# EAGLE design schemat (EAGLE 7.6.0)
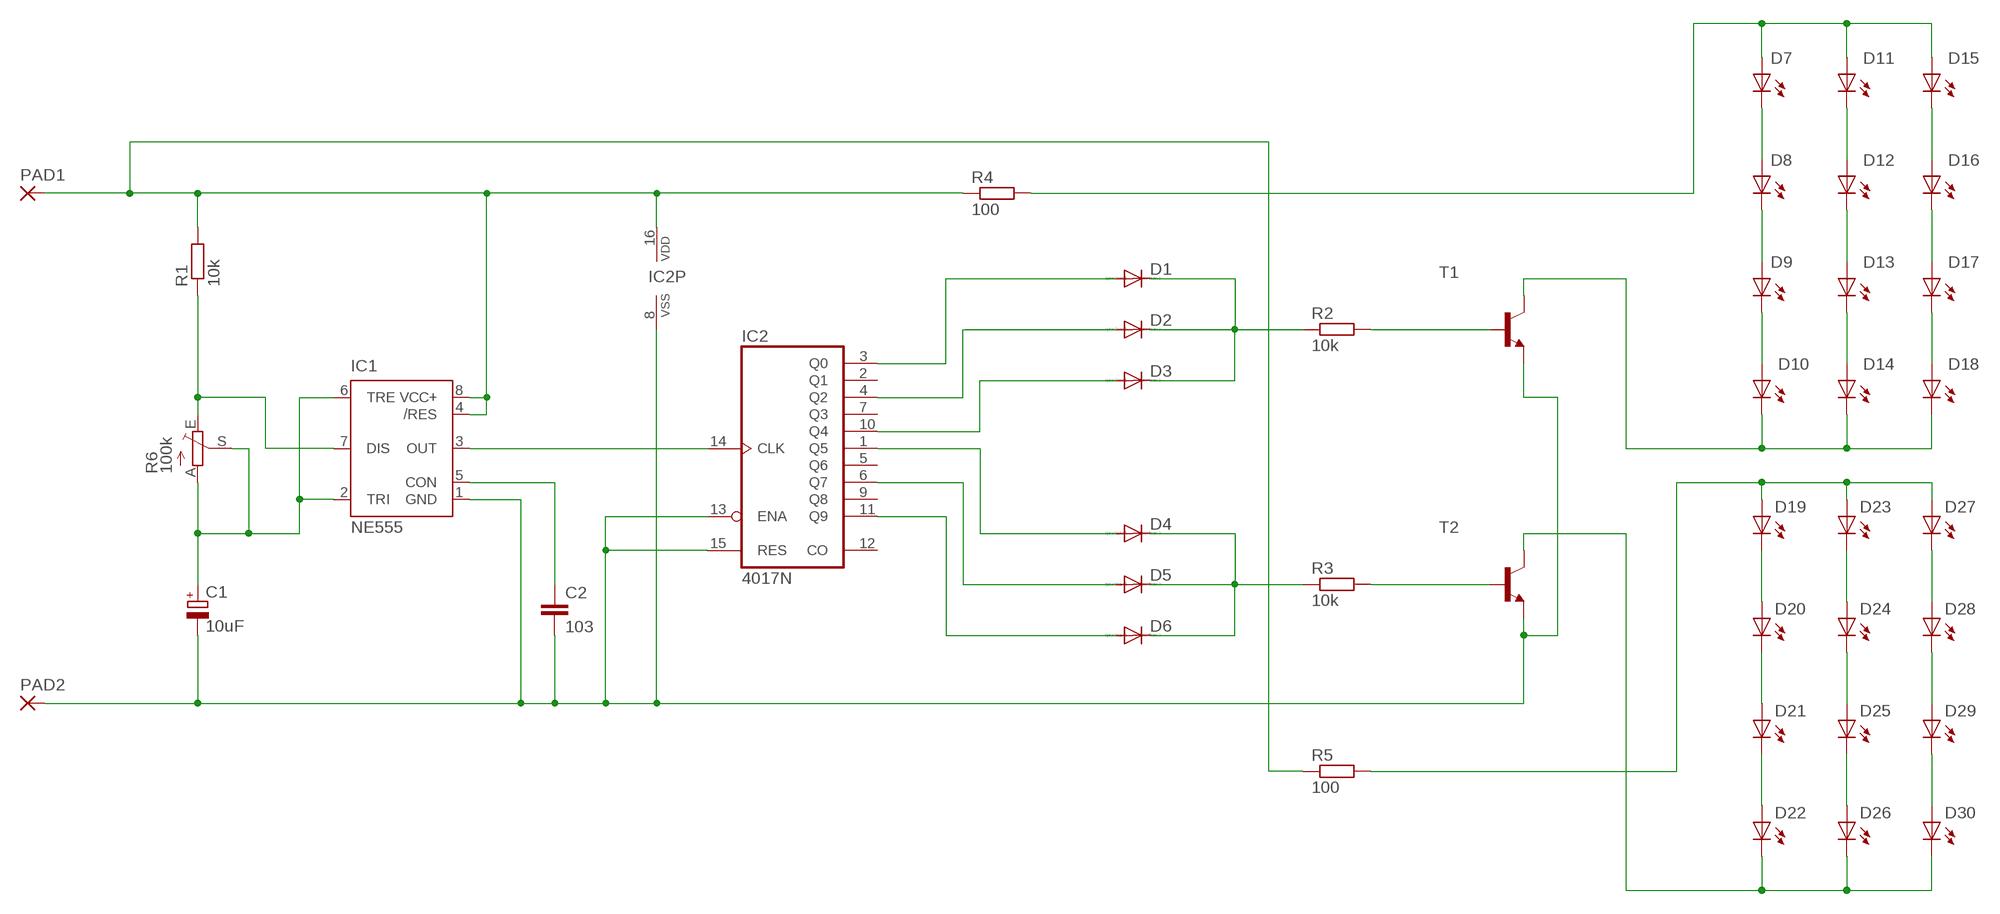
[diagram p0: schematic, sheet 1]

## Parts
C1  10uF  CPOL-EUE2-4  [E2-4]
C2  103  C-EU025-024X044  [C025-024X044]
D1  1N4148DO35-7  [DO35-7]
D2  1N4148DO35-7  [DO35-7]
D3  1N4148DO35-7  [DO35-7]
D4  1N4148DO35-7  [DO35-7]
D5  1N4148DO35-7  [DO35-7]
D6  1N4148DO35-7  [DO35-7]
D7  LED5MM  [LED5MM]
D8  LED5MM  [LED5MM]
D9  LED5MM  [LED5MM]
D10  LED5MM  [LED5MM]
D11  LED5MM  [LED5MM]
D12  LED5MM  [LED5MM]
D13  LED5MM  [LED5MM]
D14  LED5MM  [LED5MM]
D15  LED5MM  [LED5MM]
D16  LED5MM  [LED5MM]
D17  LED5MM  [LED5MM]
D18  LED5MM  [LED5MM]
D19  LED5MM  [LED5MM]
D20  LED5MM  [LED5MM]
D21  LED5MM  [LED5MM]
D22  LED5MM  [LED5MM]
D23  LED5MM  [LED5MM]
D24  LED5MM  [LED5MM]
D25  LED5MM  [LED5MM]
D26  LED5MM  [LED5MM]
D27  LED5MM  [LED5MM]
D28  LED5MM  [LED5MM]
D29  LED5MM  [LED5MM]
D30  LED5MM  [LED5MM]
IC1  NE555  [DIL-08]
IC2  4017N  [DIL16]
PAD1  WIREPAD3,17/1,3  [3,17/1,3]
PAD2  WIREPAD3,17/1,3  [3,17/1,3]
R1  10k  R-EU_0207/7  [0207/7]
R2  10k  R-EU_0207/7  [0207/7]
R3  10k  R-EU_0207/7  [0207/7]
R4  100  R-EU_0207/7  [0207/7]
R5  100  R-EU_0207/7  [0207/7]
R6  100k  TRIM_EU-CA6V  [CA6V]
T1  -NPN-TO92  [TO92]
T2  -NPN-TO92  [TO92]

## Nets
N$1: D4.C D5.C D6.C R3.1
N$2: D6.A IC2.11(Q9)
N$3: D5.A IC2.6(Q7)
N$4: D4.A IC2.1(Q5)
N$5: D3.A IC2.10(Q4)
N$6: D2.A IC2.4(Q2)
N$7: D1.A IC2.3(Q0)
N$8: D1.C D2.C D3.C R2.1
N$9: R2.2 T1.2(B)
N$10: R3.2 T2.2(B)
N$11: D10.K(C) D14.K(C) D18.K(C) T1.3(C)
N$12: D22.K(C) D26.K(C) D30.K(C) T2.3(C)
N$13: IC1.4(/RES) IC1.8(VCC+) IC2.16(VDD) PAD1.1(P) R1.2 R4.1 R5.1
N$14: D19.A D23.A D27.A R5.2
N$15: D27.K(C) D28.A
N$16: D28.K(C) D29.A
N$17: D29.K(C) D30.A
N$18: D21.K(C) D22.A
N$19: D20.K(C) D21.A
N$20: D19.K(C) D20.A
N$21: D23.K(C) D24.A
N$22: D24.K(C) D25.A
N$23: D25.K(C) D26.A
N$24: D17.K(C) D18.A
N$25: D13.K(C) D14.A
N$26: D9.K(C) D10.A
N$27: D7.K(C) D8.A
N$28: D11.K(C) D12.A
N$29: D15.K(C) D16.A
N$30: D16.K(C) D17.A
N$31: D12.K(C) D13.A
N$32: D8.K(C) D9.A
N$33: D7.A D11.A D15.A R4.2
N$35: IC1.7(DIS) R1.1 R6.E
N$36: C1.+ IC1.2(TRI) IC1.6(TRE) R6.A R6.S
N$38: C2.1 IC1.5(CON)
N$39: C1.- C2.2 IC1.1(GND) IC2.8(VSS) IC2.13(ENA) IC2.15(RES) PAD2.1(P) T1.1(E) T2.1(E)
N$40: IC1.3(OUT) IC2.14(CLK)
Unconnected: IC2.2(Q1) IC2.5(Q6) IC2.7(Q3) IC2.9(Q8) IC2.12(CO)

## Library data of the parts
C1 = resistor:CPOL-EU: POLARIZED CAPACITOR, European symbol
C2 = rcl:C-EU: CAPACITOR, European symbol
D1-D6 = diode:1N4148: DIODE high speed (Philips)
D7-D30 = led:LED: LED OSRAM: - CHIPLED LG R971, LG N971, LY N971, LG Q971, LY Q971, LO R971, LY R971 LH N974, LH R974 LS Q976, LO Q976, LY Q976 LO Q996 - Hyper CHIPLED LW Q18S LB Q993, LB Q99A, LB R99A - SideLED LS A670, LO A670, LY A670, LG A670, LP A670 LB A673, LV A673, LT A673, LW A673 LH A674 LY A675 LS A676, LA A676, LO A676, LY A676, LW A676 LS A679, LY A679, LG A679 - Hyper Micro SIDELED® LS Y876, LA Y876, LO Y876, LY Y876 LT Y87S - SmartLED LW L88C, LW L88S LB L89C, LB L89S, LG L890 LS L89K, LO L89K, LY L89K LS L896, LA L896, LO L896, LY L896 - TOPLED LS T670, LO T670, LY T670, LG T670, LP T670 LSG T670, LSP T670, LSY T670, LOP T670, LYG T670 LG T671, LOG T671, LSG T671 LB T673, LV T673, LT T673, LW T673 LH T674 LS T676, LA T676, LO T676, LY T676, LB T676, LH T676, LSB T676, LW T676 LB T67C, LV T67C, LT T67C, LS T67K, LO T67K, LY T67K, LW E67C LS E67B, LA E67B, LO E67B, LY E67B, LB E67C, LV E67C, LT E67C LW T67C LS T679, LY T679, LG T679 LS T770, LO T770, LY T770, LG T770, LP T770 LB T773, LV T773, LT T773, LW T773 LH T774 LS E675, LA E675, LY E675, LS T675 LS T776, LA T776, LO T776, LY T776, LB T776 LHGB T686 LT T68C, LB T68C - Hyper Mini TOPLED® LB M676 - Mini TOPLED Santana® LG M470 LS M47K, LO M47K, LY M47K Source: http://www.osram.convergy.de LUXEON: - LUMILED® LXK2-PW12-R00, LXK2-PW12-S00, LXK2-PW14-U00, LXK2-PW14-V00 LXK2-PM12-R00, LXK2-PM12-S00, LXK2-PM14-U00 LXK2-PE12-Q00, LXK2-PE12-R00, LXK2-PE12-S00, LXK2-PE14-T00, LXK2-PE14-U00 LXK2-PB12-K00, LXK2-PB12-L00, LXK2-PB12-M00, LXK2-PB14-N00, LXK2-PB14-P00, LXK2-PB14-Q00 LXK2-PR12-L00, LXK2-PR12-M00, LXK2-PR14-Q00, LXK2-PR14-R00 LXK2-PD12-Q00, LXK2-PD12-R00, LXK2-PD12-S00 LXK2-PH12-R00, LXK2-PH12-S00 LXK2-PL12-P00, LXK2-PL12-Q00, LXK2-PL12-R00 Source: www.luxeon.com KINGBRIGHT: KA-3528ASYC Source: www.kingbright.com
IC1 = st-microelectronics:NE555: General purpose bipolar Timer; MF: Arrow Electronics; MPN: NE555N; OC_FARNELL: 1467742; OC_NEWARK: 89K1486
IC2 = 40xx:4017: COUNTER/DIVIDER
PAD1 PAD2 = wirepad:WIREPAD: Wire PAD connect wire on PCB
R1-R5 = rcl:R-EU_: RESISTOR, European symbol
R6 = pot:TRIM_EU-: POTENTIOMETER
T1 T2 = transistor:*-NPN-: NPN Transistror BF959 corrected 2008.03.06

## Board
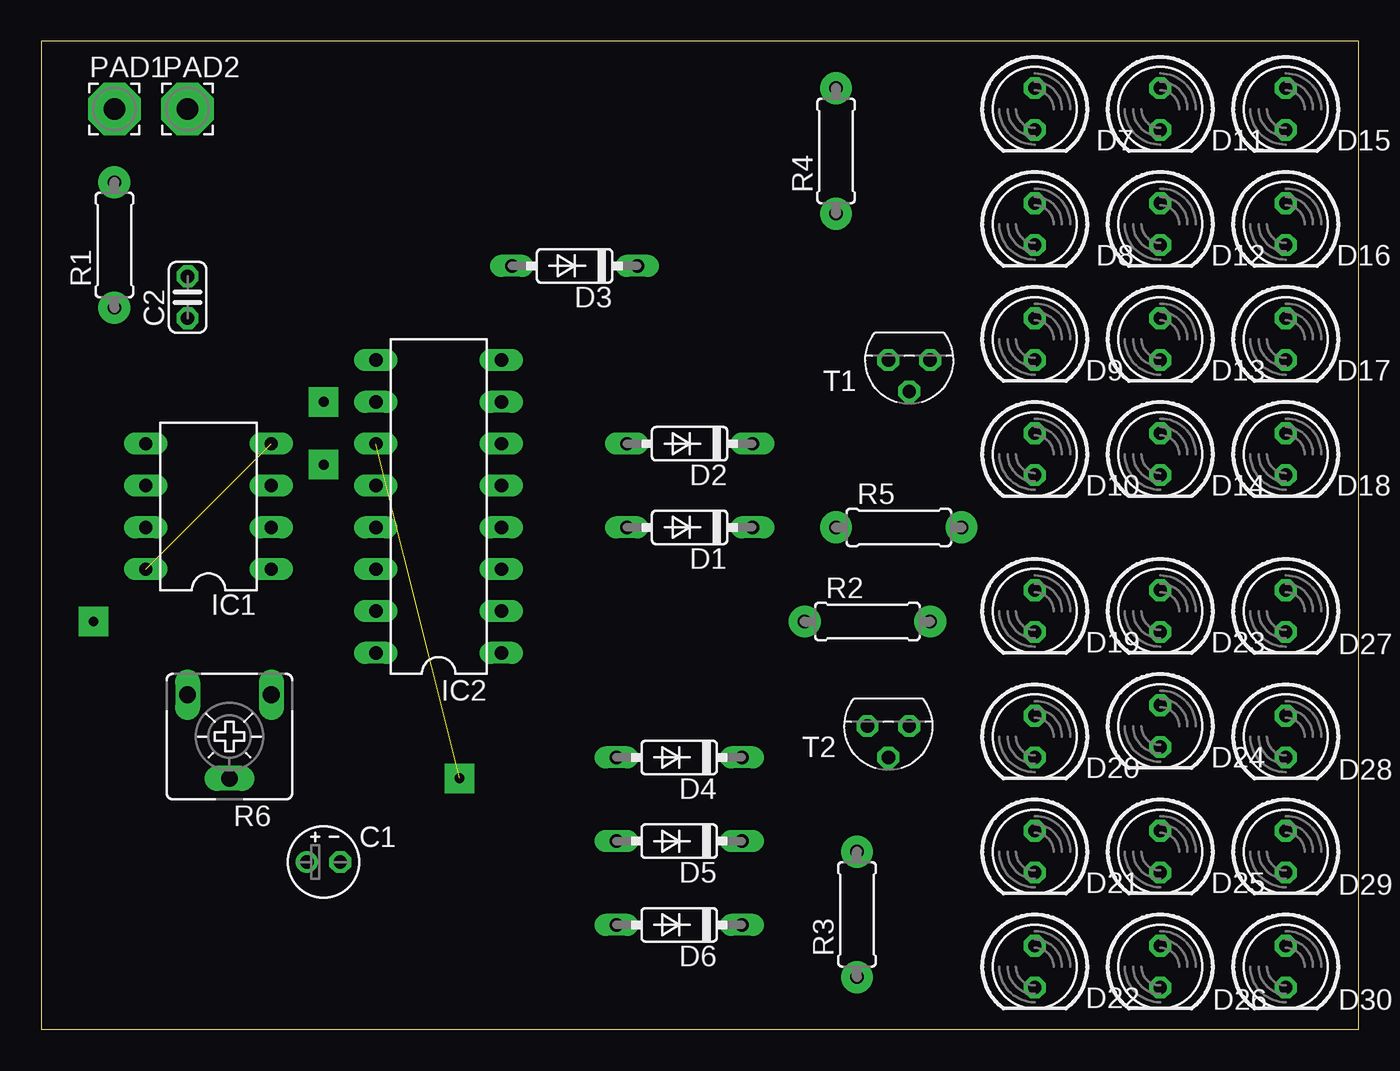
[diagram p1: board, top side]
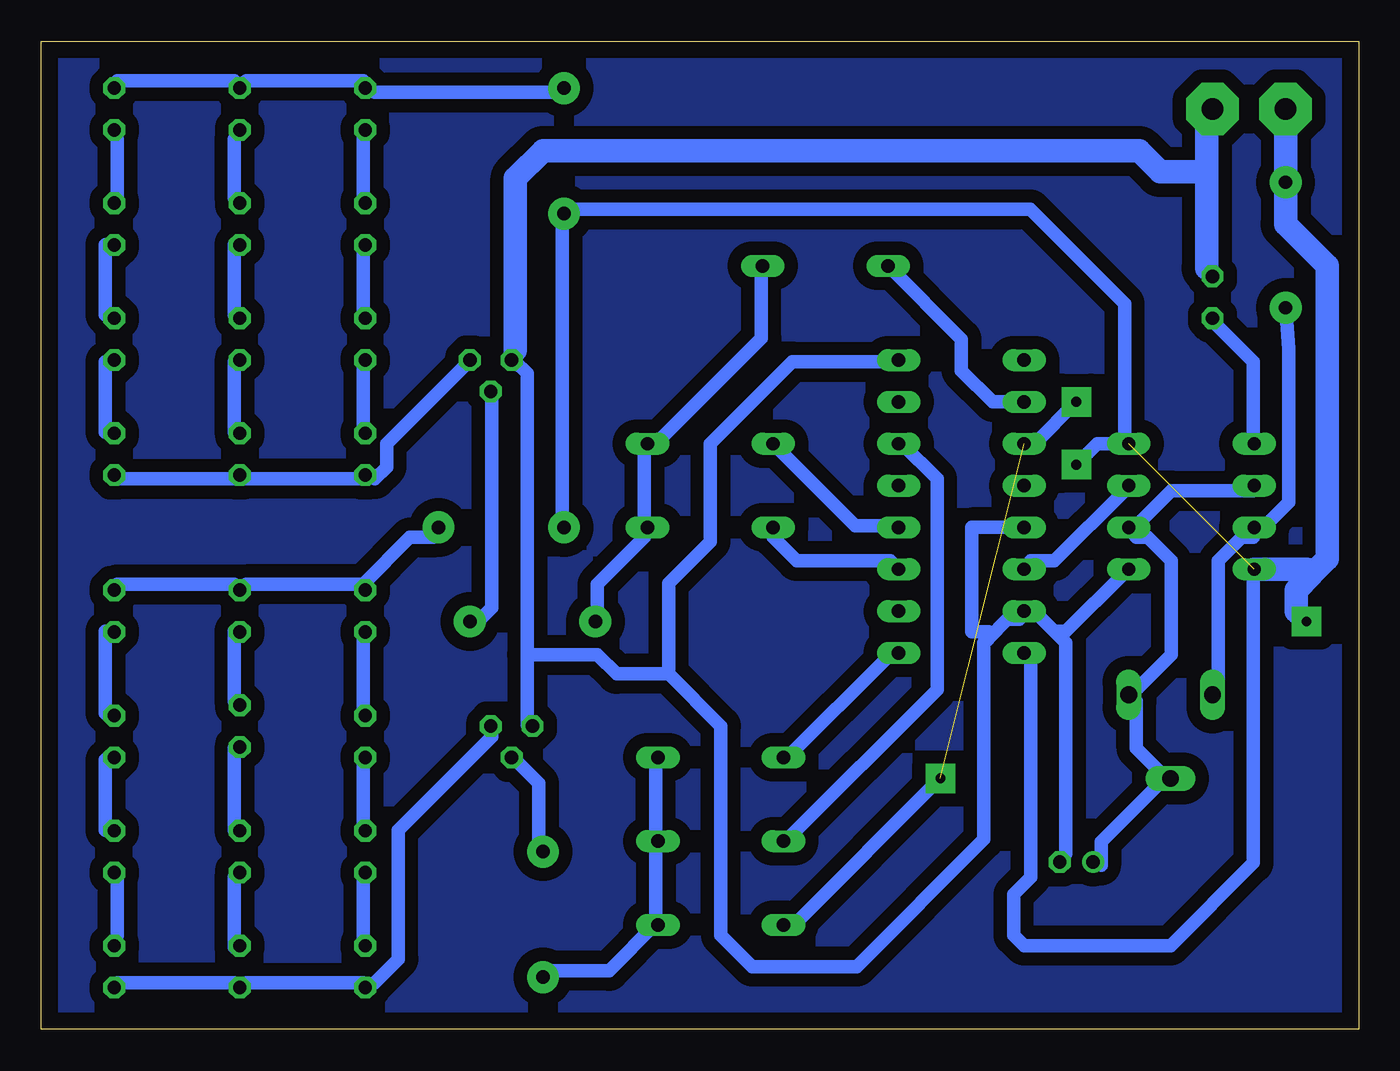
[diagram p2: board, bottom side, seen from below]

Size 80 x 60 mm. Coordinates in mm from the lower left corner, seen from the top.
Outline: 0,0 80,0 80,60 0,60 0,0
Copper layers (1*16): Top 0.035mm / dielectric 1.5mm / Bottom 0.035mm
Design rules "default *": minimum track width 32mil, minimum drill 19mil, track to track 24mil, track to pad 8mil, pad to pad 8mil, via to via 8mil, smd to smd 8mil, copper to edge 40mil, drill to drill 8mil, minimum pad ring 10mil, minimum via ring 8mil, stop-mask expansion 4mil, vias tented up to drill 0mil, thermal gap 10mil

### Footprints (pad centres in the part's own frame; a part is rotated, then mirrored left to right if it is on the bottom)
E2-4 = drill 0.813 pad 1.27: + -1.016,0 | drill 0.813 pad 1.27 octagon: - 1.016,0
C025-024X044 = drill 0.813 octagon: 1 -1.27,0; 2 1.27,0
DO35-7 = drill 0.813 long: A 3.81,0; C -3.81,0
LED5MM = drill 0.813 octagon: A -1.27,0; K 1.27,0
DIL-08 = drill 0.813 long: 1 -3.81,-3.81; 2 -1.27,-3.81; 3 1.27,-3.81; 4 3.81,-3.81; 5 3.81,3.81; 6 1.27,3.81; 7 -1.27,3.81; 8 -3.81,3.81
DIL16 = drill 0.813 long: 1 -8.89,-3.81; 2 -6.35,-3.81; 3 -3.81,-3.81; 4 -1.27,-3.81; 5 1.27,-3.81; 6 3.81,-3.81; 7 6.35,-3.81; 8 8.89,-3.81; 9 8.89,3.81; 10 6.35,3.81; 11 3.81,3.81; 12 1.27,3.81; 13 -1.27,3.81; 14 -3.81,3.81; 15 -6.35,3.81; 16 -8.89,3.81
3,17/1,3 = drill 1.321 pad 3.175 octagon: 1 0,0
0207/7 = drill 0.813 octagon: 1 -3.81,0; 2 3.81,0
CA6V = drill 1.016 long: A -2.54,-2.54; E 2.54,-2.54; S 0,2.54
TO92 = drill 0.813 octagon: 1 1.27,0; 2 0,1.905; 3 -1.27,0

### Placement (x,y rotation side)
C1  17.14,10.16 0 top
C2  8.89,44.45 90 top
D1  39.37,30.48 180 top
D2  39.37,35.56 180 top
D3  32.38,46.35 180 top
D4  38.73,16.51 180 top
D5  38.73,11.43 180 top
D6  38.73,6.35 180 top
D7  60.33,55.88 270 top
D8  60.33,48.9 270 top
D9  60.33,41.91 270 top
D10  60.33,34.92 270 top
D11  67.94,55.88 270 top
D12  67.94,48.9 270 top
D13  67.94,41.91 270 top
D14  67.94,34.92 270 top
D15  75.56,55.88 270 top
D16  75.56,48.9 270 top
D17  75.56,41.91 270 top
D18  75.56,34.92 270 top
D19  60.33,25.4 270 top
D20  60.33,17.78 270 top
D21  60.33,10.79 270 top
D22  60.33,3.81 270 top
D23  67.94,25.4 270 top
D24  67.94,18.41 270 top
D25  67.94,10.79 270 top
D26  67.94,3.81 270 top
D27  75.56,25.4 270 top
D28  75.56,17.78 270 top
D29  75.56,10.79 270 top
D30  75.56,3.81 270 top
IC1  10.16,31.75 90 top
IC2  24.13,31.75 90 top
PAD1  4.45,55.88 0 top
PAD2  8.89,55.88 0 top
R1  4.45,47.62 90 top
R2  50.16,24.77 0 top
R3  49.53,6.99 90 top
R4  48.26,53.34 90 top
R5  52.07,30.48 0 top
R6  11.43,17.78 180 top
T1  52.7,40.64 180 top
T2  51.44,18.41 180 top

### Tracks (layer width: path | path; a pad name or v marks a point on that pad's centre or on a via)
N$1
  Bottom 0.813: 42.67,11.38 42.67,6.4 | 42.67,6.4 45.52,3.56 49.07,3.56 R3.1 | 42.67,6.4 D6.C | 42.67,11.38 42.67,16.36 D4.C | 42.67,11.38 D5.C
N$2  (1 unrouted)
  Bottom 0.813: IC2.11 19.68,35.56 17.14,38.1 | D6.A 34.29,6.35 25.4,15.24
N$3
  Bottom 0.813: IC2.6 27.74,35.56 25.6,33.43 25.6,20.62 34.85,11.38 D5.A
N$4
  Bottom 0.813: IC2.1 28.45,22.76 34.85,16.36 D4.A
N$5
  Bottom 0.813: IC2.10 22.23,38.1 24.13,40.01 24.13,41.91 D3.A
N$6
  Bottom 0.813: D2.A 30.58,30.58 28.45,30.58 IC2.4
N$7
  Bottom 0.813: IC2.3 28.45,28.45 34.14,28.45 35.56,29.87 D1.A
N$8
  Bottom 0.813: D3.C 36.27,46.23 36.27,41.96 42.67,35.56 D2.C 43.38,35.56 43.38,30.58 D1.C 43.38,29.87 46.23,27.03 46.23,24.89 R2.1
N$9
  Bottom 0.813: T1.2 52.63,38.41 52.63,25.6 53.34,24.89 R2.2
N$10
  Bottom 0.813: R3.2 49.78,11.38 49.78,14.94 51.21,16.36 T2.2
N$11
  Bottom 0.813: D18.K 75.39,33.43 68.28,33.43 D14.K 67.56,33.43 60.45,33.43 D10.K 59.74,33.43 59.03,34.14 59.03,35.56 54.05,40.54 T1.3
N$12
  Bottom 0.813: T2.3 52.63,17.78 58.32,12.09 58.32,4.27 59.74,2.85 D22.K 60.45,2.85 67.56,2.85 D26.K 68.28,2.85 75.39,2.85 D30.K
N$13  (1 unrouted)
  Bottom 0.813: R5.1 48.36,30.58 48.36,49.07 R4.1 47.65,49.78 19.94,49.78 14.22,44.07 14.22,35.56 IC1.4 15.88,35.56 17.14,34.29 | IC2.16 19.91,22.76 19.91,9.25 20.95,8.2 20.95,5.71 20.32,5.08 11.43,5.08 6.4,10.11 6.4,27.74 IC1.8 | 3.17,27.94 2.86,27.62
  Bottom 1.422: PAD1.1 R1.2 4.45,48.9 1.91,46.35 1.91,28.57 2.86,27.62 3.81,26.67 3.81,25.4 3.17,24.77 | IC1.8 3.17,27.94
N$14
  Bottom 0.813: D27.A 75.39,27.03 68.28,27.03 D23.A 67.56,27.03 60.45,27.03 | 60.45,27.03 57.61,29.87 56.19,29.87 R5.2 | 60.45,27.03 D19.A
N$15
  Bottom 0.813: D28.A 76.1,19.2 76.1,24.18 D27.K
N$16
  Bottom 0.813: D29.A 76.1,12.09 76.1,16.36 D28.K
N$17
  Bottom 0.813: D30.A 75.39,5.69 75.39,9.25 D29.K
N$18
  Bottom 0.813: D22.A 60.45,5.69 60.45,9.25 D21.K
N$19
  Bottom 0.813: D21.A 60.45,12.09 60.45,16.36 D20.K
N$20
  Bottom 0.813: D20.A 60.45,19.2 60.45,24.18 D19.K
N$21
  Bottom 0.813: D24.A 68.28,19.91 68.28,24.18 D23.K
N$22
  Bottom 0.813: D25.A 68.28,12.09 68.28,17.07 D24.K
N$23
  Bottom 0.813: D26.A 68.28,4.98 68.28,9.25 D25.K
N$24
  Bottom 0.813: D18.A 76.1,36.27 76.1,40.54 D17.K
N$25
  Bottom 0.813: D14.A 68.28,36.27 68.28,40.54 D13.K
N$26
  Bottom 0.813: D10.A 60.45,36.27 60.45,40.54 D9.K
N$27
  Bottom 0.813: D8.A 60.45,50.49 60.45,54.05 D7.K
N$28
  Bottom 0.813: D12.A 68.28,50.49 68.28,54.05 D11.K
N$29
  Bottom 0.813: D16.A 75.39,50.49 75.39,54.05 D15.K
N$30
  Bottom 0.813: D17.A 76.1,43.38 76.1,47.65 D16.K
N$31
  Bottom 0.813: D13.A 68.28,43.38 68.28,47.65 D12.K
N$32
  Bottom 0.813: D9.A 60.45,43.38 60.45,47.65 D8.K
N$33
  Bottom 0.813: D15.A 75.39,57.61 68.28,57.61 D11.A 67.56,57.61 60.45,57.61 D7.A 59.74,56.9 48.36,56.9 R4.2
N$34  (via drill 0.6 pad 1.78)
  other vias: 3.17,24.77
N$35
  Bottom 0.813: R6.E 8.53,20.62 8.53,28.45 7.11,29.87 6.4,29.87 IC1.7 5.69,30.58 4.27,32 4.27,41.33 R1.1
N$36
  Bottom 0.813: IC1.6 6.4,32.72 11.38,32.72 13.51,30.58 IC1.2 13.51,29.87 12.8,29.87 11.38,28.45 11.38,22.76 13.51,20.62 R6.A 13.51,19.91 13.51,17.07 12.09,15.65 R6.S 12.09,14.94 15.65,11.38 15.65,9.96 C1.+
N$37  (via drill 0.6 pad 1.78)
  other vias: 17.14,34.29
N$38
  Bottom 0.813: IC1.5 6.4,35.56 6.4,40.54 8.53,42.67 C2.1
N$39
  Bottom 0.813: 18.49,24.18 19.91,25.6 IC2.15 20.62,24.89 21.34,24.89 22.48,23.75 | 18.49,24.18 17.78,23.47 17.78,10.67 C1.- | 18.49,24.18 17.78,24.18 14.22,27.74 IC1.1 | 9.25,46.23 C2.2 | 50.49,22.76 50.49,39.83 51.21,40.54 T1.1 51.21,41.25 | 50.49,22.76 50.49,18.49 T2.1 | 50.49,22.76 46.23,22.76 45.06,21.59 41.91,21.59 | IC2.8 28.45,40.54 34.39,40.54 39.37,35.56 39.37,29.62 41.91,27.08 41.91,21.59 | 22.48,23.75 22.76,23.47 22.76,11.53 30.48,3.81 36.83,3.81 38.73,5.71 38.73,18.41 41.91,21.59 | 9.88,52.07 9.25,51.44 | IC2.13 23.5,30.48 23.5,24.13 22.48,24.13 22.48,23.75 | 9.25,55.47 PAD2.1
  Bottom 1.422: 9.25,55.47 9.25,51.44 9.25,46.23 | 51.21,41.25 51.21,51.66 49.53,53.34 13.34,53.34 12.06,52.07 9.88,52.07
N$40
  Bottom 0.813: IC2.14 19.91,28.45 18.49,28.45 14.22,32.72 IC1.3
N$41  (via drill 0.6 pad 1.78)
  other vias: 17.14,38.1
N$42  (via drill 0.6 pad 1.78)
  other vias: 25.4,15.24
N$43  (via drill 0.48 pad 1.93)
  other vias: 48.26,57.15
N$44  (via drill 0.48 pad 1.93)
  other vias: 48.26,49.53
N$45  (via drill 0.48 pad 1.93)
  other vias: 48.26,30.48
N$46  (via drill 0.48 pad 1.93)
  other vias: 49.53,3.17
N$47  (via drill 0.48 pad 1.93)
  other vias: 49.53,10.79
N$48  (via drill 0.48 pad 1.93)
  other vias: 53.98,24.77
N$49  (via drill 0.48 pad 1.93)
  other vias: 46.35,24.77
N$50  (via drill 0.48 pad 1.93)
  other vias: 55.88,30.48
N$51  (via drill 0.48 pad 1.93)
  other vias: 4.45,51.44
N$52  (via drill 0.48 pad 1.93)
  other vias: 4.45,43.81
N$53
  pour Bottom (isolate 0.813): 0,0 0,60.33 80.01,60.33 80.01,0